# Altium schematic sheet 14_Radar_interfaces_and_QSPI.SchDoc
size 289 x 396 mm
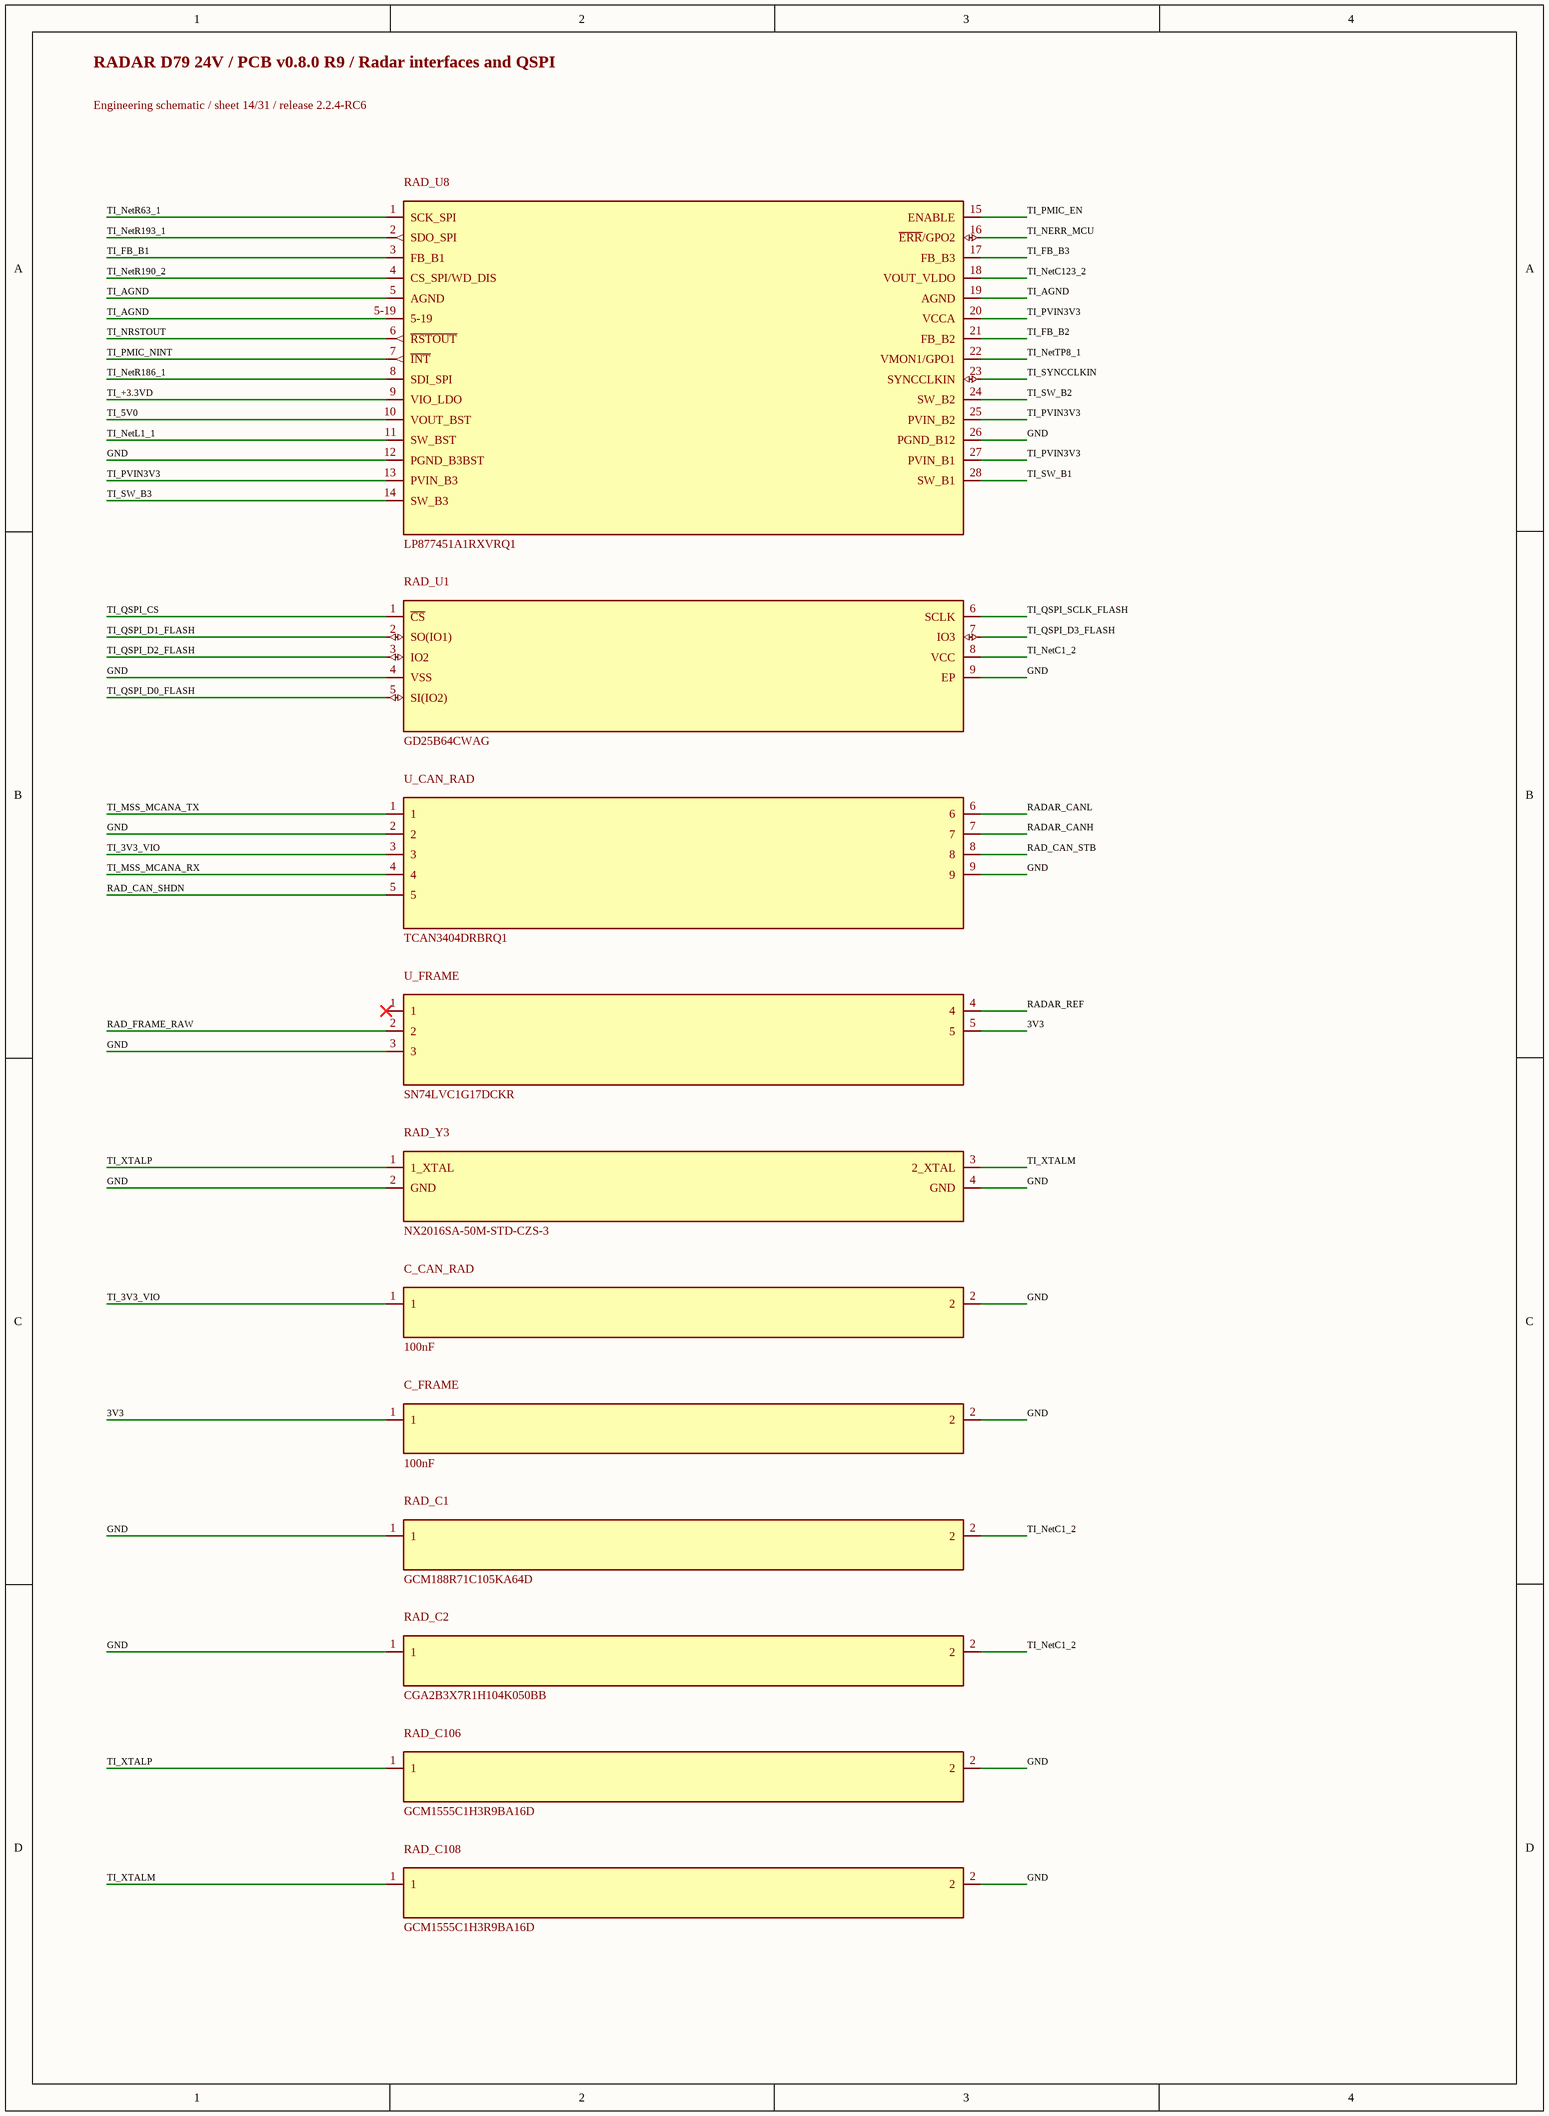
[diagram p0: 14_Radar_interfaces_and_QSPI.SchDoc]

## Parts
C_CAN_RAD  100nF  [C_0402_1005Metric]
C_FRAME  100nF  [C_0402_1005Metric]
RAD_C1  GCM188R71C105KA64D  [0603L]
RAD_C2  CGA2B3X7R1H104K050BB  [0402L]
RAD_C106  GCM1555C1H3R9BA16D  [FP-GCM1555C1H3R9BA16D_0402-MFG]
RAD_C108  GCM1555C1H3R9BA16D  [FP-GCM1555C1H3R9BA16D_0402-MFG]
RAD_U1  GD25B64CWAG  [FP-GD25B64CWAG_WSON8-IPC_C]
RAD_U8  LP877451A1RXVRQ1  [RXV0028A-MFG]
RAD_Y3  NX2016SA-50M-STD-CZS-3  [FP-NX2016SA-50M-STD-CZS-3_SMT4_2MM0_1MM6-MFG]
U_CAN_RAD  TCAN3404DRBRQ1  [Texas_DRB0008A]
U_FRAME  SN74LVC1G17DCKR  [DCK0005A_N]

## Nets
3V3: C_FRAME.1 U_FRAME.5
GND: C_CAN_RAD.2 C_FRAME.2 RAD_C1.1 RAD_C2.1 RAD_C106.2 RAD_C108.2 RAD_U1.4(VSS) RAD_U1.9(EP) RAD_U8.12(PGND_B3BST) RAD_U8.26(PGND_B12) RAD_Y3.2(GND) RAD_Y3.4(GND) U_CAN_RAD.2 U_CAN_RAD.9 U_FRAME.3
RAD_CAN_SHDN: U_CAN_RAD.5
RAD_CAN_STB: U_CAN_RAD.8
RAD_FRAME_RAW: U_FRAME.2
RADAR_CANH: U_CAN_RAD.7
RADAR_CANL: U_CAN_RAD.6
RADAR_REF: U_FRAME.4
TI_3V3_VIO: C_CAN_RAD.1 U_CAN_RAD.3
TI_5V0: RAD_U8.10(VOUT_BST)
TI_+3.3VD: RAD_U8.9(VIO_LDO)
TI_AGND: RAD_U8.5(AGND) RAD_U8.5-19 RAD_U8.19(AGND)
TI_FB_B1: RAD_U8.3(FB_B1)
TI_FB_B2: RAD_U8.21(FB_B2)
TI_FB_B3: RAD_U8.17(FB_B3)
TI_MSS_MCANA_RX: U_CAN_RAD.4
TI_MSS_MCANA_TX: U_CAN_RAD.1
TI_NERR_MCU: RAD_U8.16(~{ERR}/GPO2)
TI_NetC1_2: RAD_C1.2 RAD_C2.2 RAD_U1.8(VCC)
TI_NetC123_2: RAD_U8.18(VOUT_VLDO)
TI_NetL1_1: RAD_U8.11(SW_BST)
TI_NetR63_1: RAD_U8.1(SCK_SPI)
TI_NetR186_1: RAD_U8.8(SDI_SPI)
TI_NetR190_2: RAD_U8.4(CS_SPI/WD_DIS)
TI_NetR193_1: RAD_U8.2(SDO_SPI)
TI_NetTP8_1: RAD_U8.22(VMON1/GPO1)
TI_NRSTOUT: RAD_U8.6(~{RSTOUT})
TI_PMIC_EN: RAD_U8.15(ENABLE)
TI_PMIC_NINT: RAD_U8.7(~{INT})
TI_PVIN3V3: RAD_U8.13(PVIN_B3) RAD_U8.20(VCCA) RAD_U8.25(PVIN_B2) RAD_U8.27(PVIN_B1)
TI_QSPI_CS: RAD_U1.1(~{CS})
TI_QSPI_D0_FLASH: RAD_U1.5(SI(IO2))
TI_QSPI_D1_FLASH: RAD_U1.2(SO(IO1))
TI_QSPI_D2_FLASH: RAD_U1.3(IO2)
TI_QSPI_D3_FLASH: RAD_U1.7(IO3)
TI_QSPI_SCLK_FLASH: RAD_U1.6(SCLK)
TI_SW_B1: RAD_U8.28(SW_B1)
TI_SW_B2: RAD_U8.24(SW_B2)
TI_SW_B3: RAD_U8.14(SW_B3)
TI_SYNCCLKIN: RAD_U8.23(SYNCCLKIN)
TI_XTALM: RAD_C108.1 RAD_Y3.3(2_XTAL)
TI_XTALP: RAD_C106.1 RAD_Y3.1(1_XTAL)

Not connected (* = marked no-connect by the designer): U_FRAME 1*

## Notes on the sheet
- RADAR D79 24V / PCB v0.8.0 R9 / Radar interfaces and QSPI
- Engineering schematic / sheet 14/31 / release 2.2.4-RC6